# Altium project PCB_Project2.PrjPCB
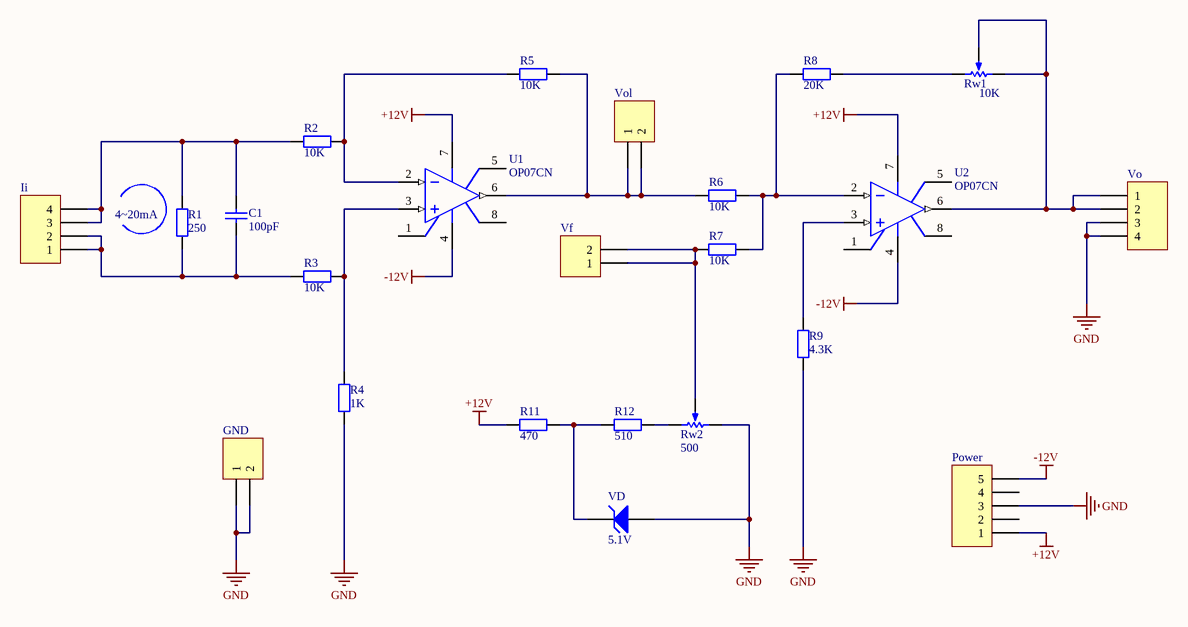
[diagram p0: S67_07_2460.SchDoc]
1 sheet, 23 parts. Net scope: global (net labels, ports and power ports of the same name join across sheets).
Board file: S67_07_2460.PcbDoc

## Sheet S67_07_2460.SchDoc
size A4

### Parts
C1  value 100pF  [RAD0.2]  (hidden comment: Cap)
GND  Header 2  [SIP-2]  (value not drawn)
Ii  Header 4  [SIP-4]  (value not drawn)
Power  Header 5  [POWER PLUG5]  (value not drawn)
R1  value 250  [AXIAL-0.4]  (hidden comment: Res2)
R2  value 10K  [AXIAL-0.4]  (hidden comment: Res2)
R3  value 10K  [AXIAL-0.4]  (hidden comment: Res2)
R4  value 1K  [AXIAL-0.4]  (hidden comment: Res2)
R5  value 10K  [AXIAL-0.4]  (hidden comment: Res2)
R6  value 10K  [AXIAL-0.4]  (hidden comment: Res2)
R7  value 10K  [AXIAL-0.4]  (hidden comment: Res2)
R8  value 20K  [AXIAL-0.4]  (hidden comment: Res2)
R9  value 4.3K  [AXIAL-0.4]  (hidden comment: Res2)
R11  value 470  [AXIAL-0.4]  (hidden comment: Res2)
R12  value 510  [AXIAL-0.4]  (hidden comment: Res2)
Rw1  value 10K  [VR5]  (hidden comment: RPot)
Rw2  value 500  [VR5]  (hidden comment: RPot)
U1  OP07CN  [DIP8]
U2  OP07CN  [DIP8]
VD  5.1V  [DIODE0.4]
Vf  Header 2  [SIP-2]  (value not drawn)
Vo  Header 4  [SIP-4]  (value not drawn)
Vol  Header 2  [SIP-2]  (value not drawn)

### Nets
+12V: Power.1 R11.2 U1.7(V+) U2.7(V+)
-12V: Power.5 U1.4(V-) U2.4(V-)
GND: GND.1 GND.2 Power.3 R4.2 R9.1 Rw2.1(TOP) VD.1(A) Vo.3 Vo.4
NetC1_1: C1.1 Ii.1 Ii.2 R1.1 R3.2
NetC1_2: C1.2 Ii.3 Ii.4 R1.2 R2.2
NetR2_1: R2.1 R5.1 U1.2(IN-)
NetR3_1: R3.1 R4.1 U1.3(IN+)
NetR5_2: R5.2 R6.1 U1.6(OUT) Vol.1 Vol.2
NetR6_2: R6.2 R7.2 R8.1 U2.2(IN-)
NetR7_1: R7.1 Rw2.2(TAP) Vf.1 Vf.2
NetR8_2: R8.2 Rw1.3(BOT)
NetR9_2: R9.2 U2.3(IN+)
NetR11_1: R11.1 R12.2 VD.2(K)
NetR12_1: R12.1 Rw2.3(BOT)
NetRw1_1: Rw1.1(TOP) Rw1.2(TAP) U2.6(OUT) Vo.1 Vo.2

Not connected (* = marked no-connect by the designer): Power 2 4; U1 1(NULL1) 5(NC) 8(NULL2); U2 1(NULL1) 5(NC) 8(NULL2)

### Notes on the sheet
- (near R1) 4~20mA

### Library data of the parts
C1 = Cap: Capacitor; Published: 8-Jun-2000; LatestRevisionDate: 17-Jul-2002; LatestRevisionNote: Re-released for DXP Platform.; PackageReference: RAD-0.3; Publisher: Altium Limited
GND Vf Vol = Header 2: Header, 2-Pin; LatestRevisionDate: 17-Jul-2002; LatestRevisionNote: Re-released for DXP Platform.; Publisher: Altium Limited
Ii Vo = Header 4: Header, 4-Pin; LatestRevisionDate: 17-Jul-2002; LatestRevisionNote: Re-released for DXP Platform.; Publisher: Altium Limited
Power = Header 5: Header, 5-Pin; LatestRevisionDate: 17-Jul-2002; LatestRevisionNote: Re-released for DXP Platform.; Publisher: Altium Limited
R1-R9 R11 R12 = Res2: Resistor; Published: 8-Jun-2000; LatestRevisionDate: 17-Jul-2002; LatestRevisionNote: Re-released for DXP Platform.; PackageReference: AXIAL-0.4; Publisher: Altium Limited
Rw1 Rw2 = RPot: Potentiometer; Sim Note: Enter the Resistance value and the set point into parameter fields.; Set Position: 0.5; Published: 8-Jun-2000; LatestRevisionDate: 17-Jul-2002; LatestRevisionNote: Re-released for DXP Platform.; PackageReference: VR5; Publisher: Altium Limited
U1 U2 = OP07CN: Very Low Offset Single Bipolar Operational Amplifier; Note: Pins 5 is Not Connected; Published: 24-Aug-2001; LatestRevisionDate: 06-Jun-2005; LatestRevisionNote: Stylized 3D Model Added.; DatasheetVersion: Oct-1997; PackageReference: DIP8; Publisher: Altium Limited; PackageDescription: DIP; 8 Leads; Row Spacing 7.62 mm; Pitch 2.54 mm; Code_JEDEC: MO-001-AN; ComponentLink1Description: Manufacturer Link; ComponentLink1URL: http://www.st.com/; ComponentLink2Description: Datasheet; ComponentLink2URL: http://www.st.com/stonline/products/literature/ds/2184/op07.pdf
VD = D Zener: Zener Diode; Published: 8-Jun-2000; LatestRevisionDate: 17-Jul-2002; LatestRevisionNote: Re-released for DXP Platform.; PackageReference: DIODE-0.7; Publisher: Altium Limited